# Altium project MeadowMinimum.PrjPcb
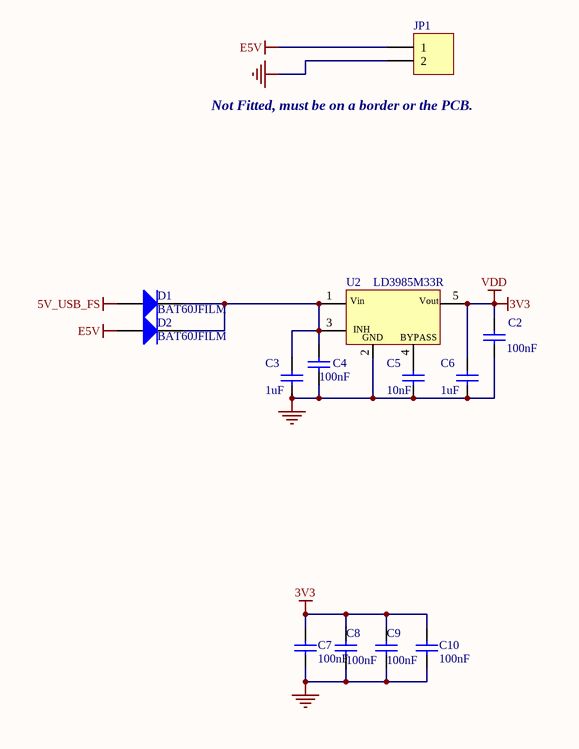
[diagram p0: Power.SchDoc]
5 sheets, 107 parts. Net scope: flat (ports and power ports of the same name join across sheets).
Board file: MeadowMinimum.PcbDoc
Sheets:
  Power.SchDoc
  STM32F7.SchDoc
  USB_OTG_FS.SchDoc
  FLASH QSPI.SchDoc
  SRAM.SchDoc

## Sheet Power.SchDoc
size A4

### Parts
C2  100nF  [0603]
C3  1uF  [0603]
C4  100nF  [0603]
C5  10nF  [0603]
C6  1uF  [0603]
C7  100nF  [0603]
C8  100nF  [0603]
C9  100nF  [0603]
C10  100nF  [0603]
D1  BAT60JFILM  [BAT60JFILM]
D2  BAT60JFILM  [BAT60JFILM]
JP1  Header 2  [HDR1X2]  (value not drawn)
U2  LD3985M33R  [LD3985M33R]

### Nets
3V3: C2.2 C6.1 C7.1 C8.2 C9.1 C10.1 U2.5(Vout)  [also labelled VDD]
5V_USB_FS: D1.1(A)  [project net 5V]
E5V: D2.1(A) JP1.1
GND: C2.1 C3.1 C4.1 C5.1 C6.2 C7.2 C8.1 C9.2 C10.2 JP1.2 U2.2(GND)
NetC3_2: C3.2 C4.2 D1.2(K) D2.2(K) U2.1(Vin) U2.3(CE)
NetC5_2: C5.2 U2.4(BYPASS)

### Notes on the sheet
- (near JP1) Not Fitted, must be on a border or the PCB.
- (in symbol LD3985M33R) INH

### Library data of the parts
C2 C4 C7-C10 = Cap_100nF_X7R_10%_0402: 0201; Manuf_Part_1: CC0402KRX7R7BB104; Manuf_1: YAGEO; Revision: July-2002: Re-released for DXP Platform.; Value: 100nF; Order: CC0402KRX7R7BB104
C3 C6 = Cap_1uF_X5R_10%_0603: 0201; Manuf_Part_1: CC0603KRX5R7BB105; Manuf_1: YAGEO; Revision: July-2002: Re-released for DXP Platform.; Value: 1uF; Order: CC0603KRX5R7BB105
C5 = Cap_10nF_X7R_10%_0603: 0201; Manuf_Part_1: CC0603KRX7R9BB103; Manuf_1: YAGEO; Revision: July-2002: Re-released for DXP Platform.; Value: 10nF; Order: CC0603KRX7R9BB103
D1 D2 = BAT60JFILM: Manuf_1: STM; Provided: ST; ECCN_US/EU: EAR99/NEC; Ref St: 9151097; Revision: July-2002: Re-released for DXP Platform.; Order: BAT60JFILM; Manuf_Part_1: BAT60JFILM; Distrib: ST
JP1 = Header 2: Header, 2-Pin; LatestRevisionDate: 17-Jul-2002; LatestRevisionNote: Re-released for DXP Platform.; Publisher: Altium Limited
U2 = LD3985M33R: Ultra low drop-low noise BiCMOS voltage, regulators low ESR capacitors compatible; Manuf_1: STM; Provided: ST; Ref St: 9176161; ECCN_US/EU: EAR99/NEC; Manuf_Part_1: LD3985M33R; Distrib: ST; Order: LD3985M33R

## Sheet STM32F7.SchDoc
size A3
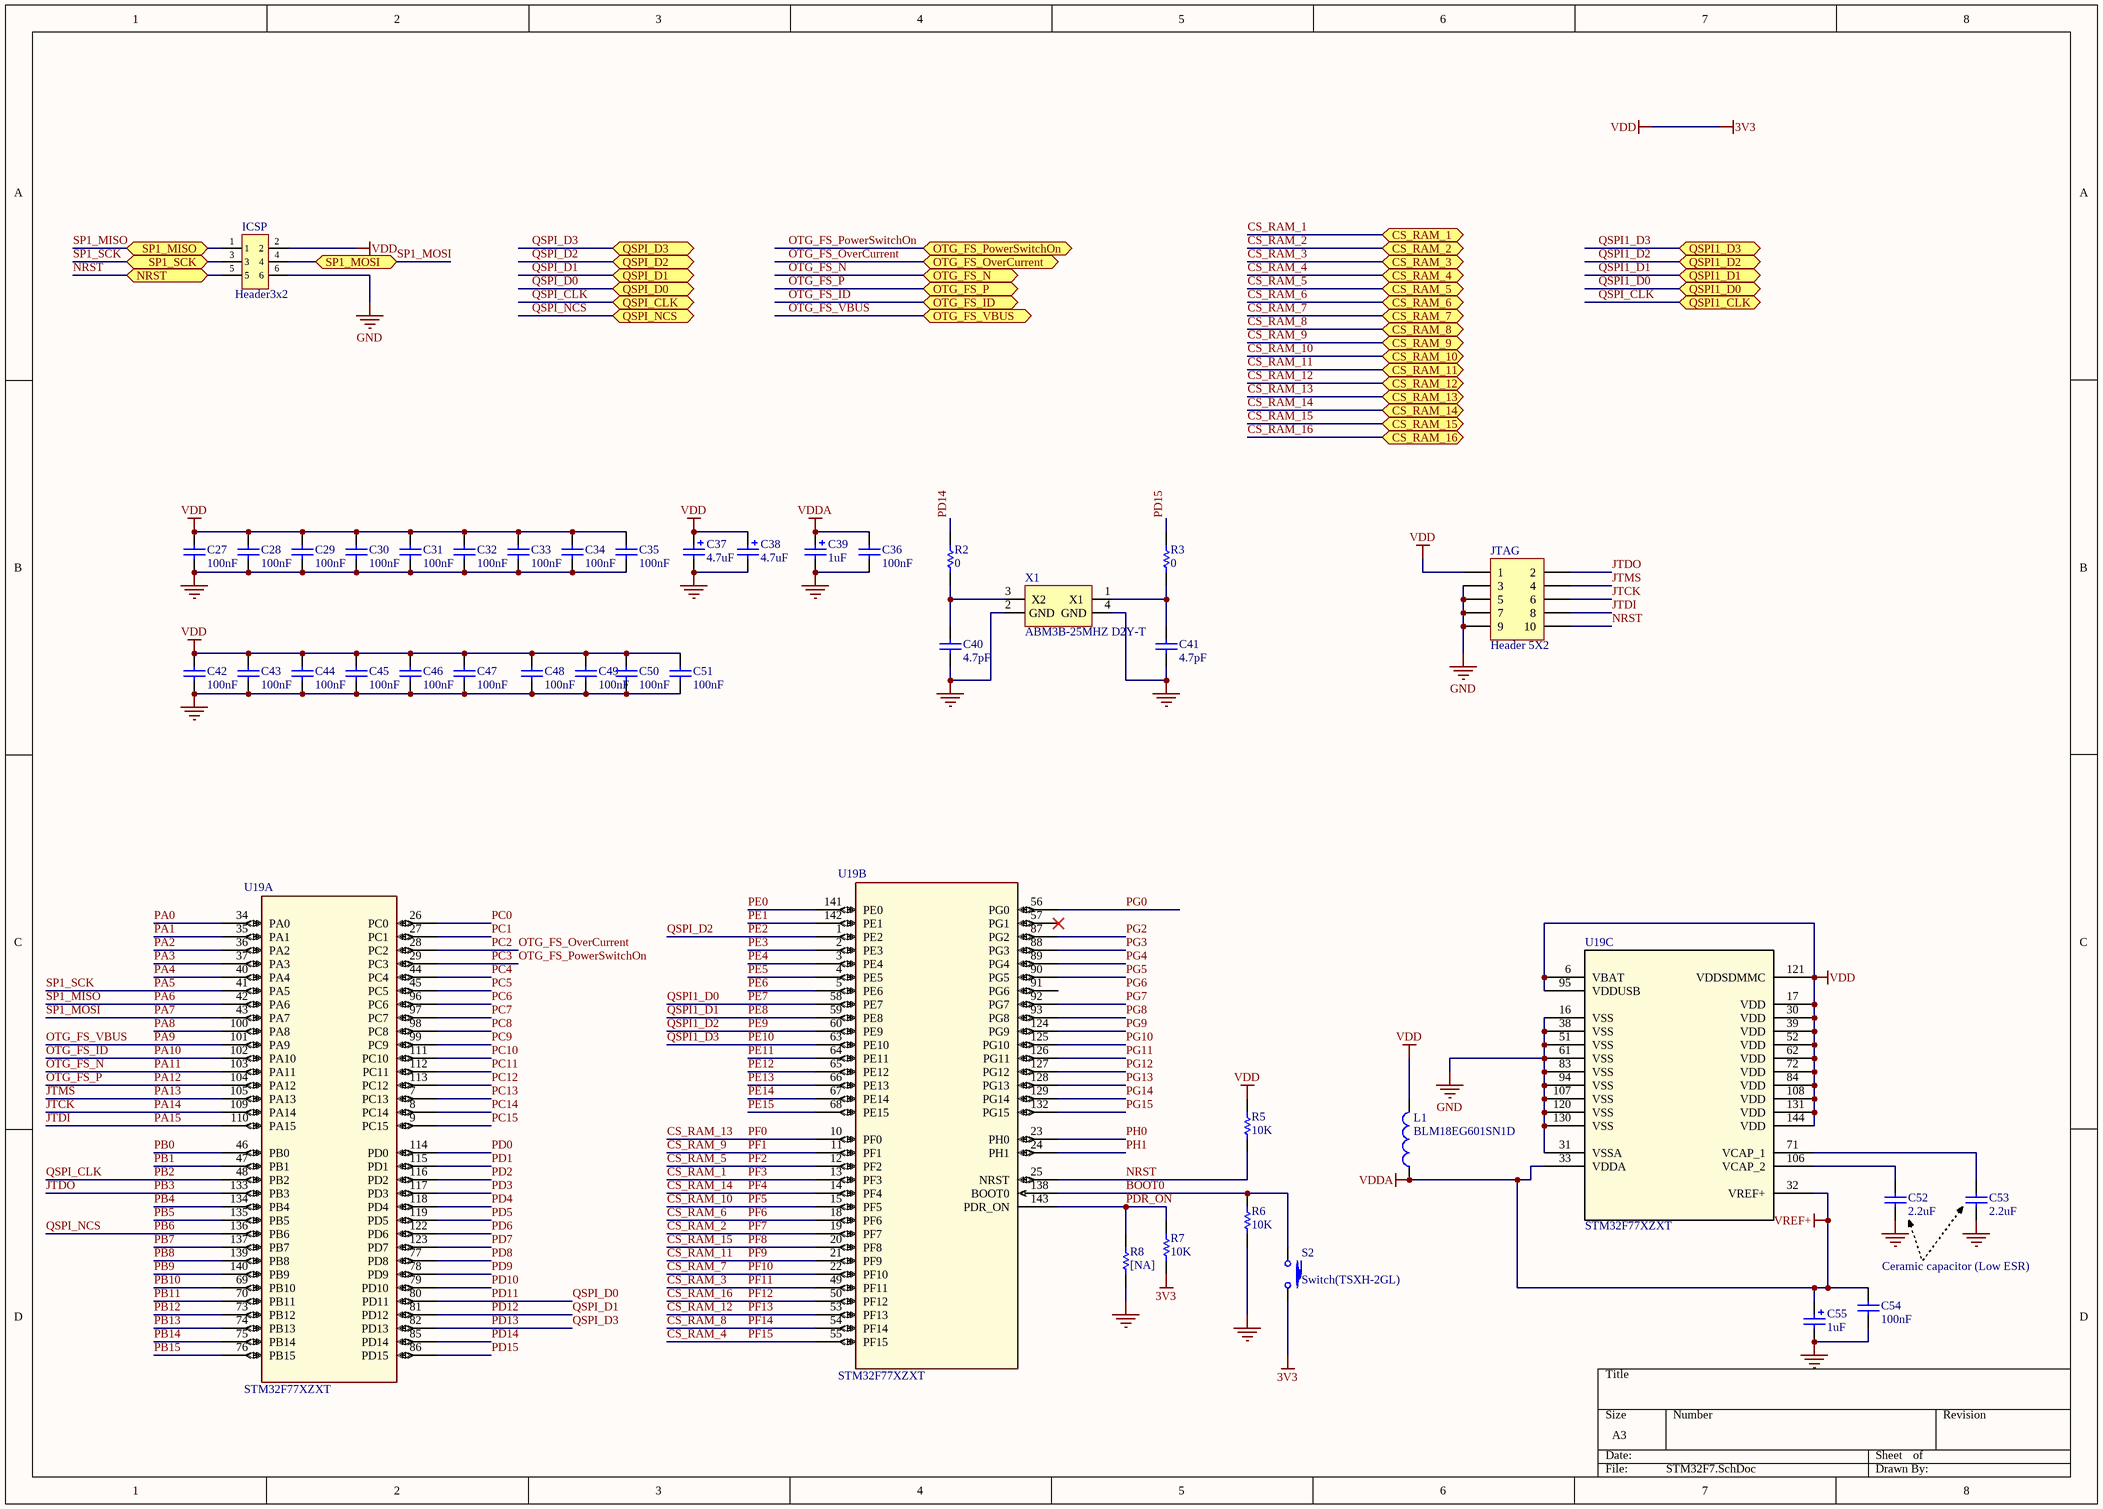
[diagram p1: STM32F7.SchDoc]

### Parts
C27  100nF  [0603]
C28  100nF  [0603]
C29  100nF  [0603]
C30  100nF  [0603]
C31  100nF  [0603]
C32  100nF  [0603]
C33  100nF  [0603]
C34  100nF  [0603]
C35  100nF  [0603]
C36  100nF  [0603]
C37  4.7uF  [0603]
C38  4.7uF  [0603]
C39  1uF  [0603]
C40  4.7pF  [0603]
C41  4.7pF  [0603]
C42  100nF  [0603]
C43  100nF  [0603]
C44  100nF  [0603]
C45  100nF  [0603]
C46  100nF  [0603]
C47  100nF  [0603]
C48  100nF  [0603]
C49  100nF  [0603]
C50  100nF  [0603]
C51  100nF  [0603]
C52  2.2uF  [0603]
C53  2.2uF  [0603]
C54  100nF  [0603]
C55  1uF  [0603]
ICSP  Header3x2  [6 pin Header]
JTAG  Header 5X2  [10 Pin Header]
L1  BLM18EG601SN1D  [0603]
R2  0  [0603]
R3  0  [0603]
R5  10K  [0603]
R6  10K  [0603]
R7  10K  [0603]
R8  [NA]  [0603]
S2  Switch(TSXH-2GL)  [Switch]
U19  STM32F77XZXT  [STM32F777ZI]  (parts A,B,C of 3)
X1  ABM3B-25MHZ D2Y-T  [25MHZ ABM3B-25MHZ D2Y-T]

### Ports
CS_RAM_1, CS_RAM_2, CS_RAM_3, CS_RAM_4, CS_RAM_5, CS_RAM_6, CS_RAM_7, CS_RAM_8, CS_RAM_9, CS_RAM_10, CS_RAM_11, CS_RAM_12, CS_RAM_13, CS_RAM_14, CS_RAM_15, CS_RAM_16, NRST, OTG_FS_ID, OTG_FS_N, OTG_FS_OverCurrent, OTG_FS_P, OTG_FS_PowerSwitchOn, OTG_FS_VBUS, QSPI1_CLK, QSPI1_D0, QSPI1_D1, QSPI1_D2, QSPI1_D3, QSPI_CLK, QSPI_D0, QSPI_D1, QSPI_D2, QSPI_D3, QSPI_NCS, SP1_MISO, SP1_MOSI, SP1_SCK

### Nets
3V3: C27.1 C28.1 C29.1 C30.1 C31.1 C32.1 C33.1 C34.1 C35.1 C37.1 C38.1 C42.1 C43.1 C44.1 C45.1 C46.1 C47.1 C48.1 C49.1 C50.1 C51.1 ICSP.2 JTAG.1 L1.2 R5.2 R7.1 S2.2 U19.6(VBAT) U19.17(VDD) U19.30(VDD) U19.39(VDD) U19.52(VDD) U19.62(VDD) U19.72(VDD) U19.84(VDD) U19.95(VDDUSB) U19.108(VDD) U19.121(VDDSDMMC) U19.131(VDD) U19.144(VDD)  [also labelled VDD]
GND: C27.2 C28.2 C29.2 C30.2 C31.2 C32.2 C33.2 C34.2 C35.2 C36.2 C37.2 C38.2 C39.2 C40.2 C41.2 C42.2 C43.2 C44.2 C45.2 C46.2 C47.2 C48.2 C49.2 C50.2 C51.2 C52.2 C53.2 C54.2 C55.2 ICSP.6 JTAG.3 JTAG.5 JTAG.7 JTAG.9 R6.2 R8.2 U19.16(VSS) U19.31(VSSA) U19.38(VSS) U19.51(VSS) U19.61(VSS) U19.83(VSS) U19.94(VSS) U19.107(VSS) U19.120(VSS) U19.130(VSS) X1.2(GND) X1.4(GND)
VDDA: C36.1 C39.1 C54.1 C55.1 L1.1 U19.32(VREF+) U19.33(VDDA)  [also labelled VREF+]
BOOT0: R6.1 S2.1 U19.138(BOOT0)
CS_RAM_1: U19.13(PF3) ; port CS_RAM_1  [also labelled PF3]
CS_RAM_2: U19.19(PF7) ; port CS_RAM_2  [also labelled PF7]
CS_RAM_3: U19.49(PF11) ; port CS_RAM_3  [also labelled PF11]
CS_RAM_4: U19.55(PF15) ; port CS_RAM_4  [also labelled PF15]
CS_RAM_5: U19.12(PF2) ; port CS_RAM_5  [also labelled PF2]
CS_RAM_6: U19.18(PF6) ; port CS_RAM_6  [also labelled PF6]
CS_RAM_7: U19.22(PF10) ; port CS_RAM_7  [also labelled PF10]
CS_RAM_8: U19.54(PF14) ; port CS_RAM_8  [also labelled PF14]
CS_RAM_9: U19.11(PF1) ; port CS_RAM_9  [also labelled PF1]
CS_RAM_10: U19.15(PF5) ; port CS_RAM_10  [also labelled PF5]
CS_RAM_11: U19.21(PF9) ; port CS_RAM_11  [also labelled PF9]
CS_RAM_12: U19.53(PF13) ; port CS_RAM_12  [also labelled PF13]
CS_RAM_13: U19.10(PF0) ; port CS_RAM_13  [also labelled PF0]
CS_RAM_14: U19.14(PF4) ; port CS_RAM_14  [also labelled PF4]
CS_RAM_15: U19.20(PF8) ; port CS_RAM_15  [also labelled PF8]
CS_RAM_16: U19.50(PF12) ; port CS_RAM_16  [also labelled PF12]
JTCK: JTAG.6 U19.109(PA14)  [also labelled PA14]
JTDI: JTAG.8 U19.110(PA15)  [also labelled PA15]
JTDO: JTAG.2 U19.133(PB3)  [also labelled PB3]
JTMS: JTAG.4 U19.105(PA13)  [also labelled PA13]
NRST: ICSP.5 JTAG.10 R5.1 U19.25(NRST) ; port NRST
OTG_FS_ID: U19.102(PA10) ; port OTG_FS_ID  [also labelled PA10]
OTG_FS_N: U19.103(PA11) ; port OTG_FS_N  [also labelled PA11]
OTG_FS_OverCurrent: U19.28(PC2) ; port OTG_FS_OverCurrent  [also labelled PC2]
OTG_FS_P: U19.104(PA12) ; port OTG_FS_P  [also labelled PA12]
OTG_FS_PowerSwitchOn: U19.29(PC3) ; port OTG_FS_PowerSwitchOn  [also labelled PC3]
OTG_FS_VBUS: U19.101(PA9) ; port OTG_FS_VBUS  [also labelled PA9]
PA0: U19.34(PA0)
PA1: U19.35(PA1)
PA2: U19.36(PA2)
PA3: U19.37(PA3)
PA4: U19.40(PA4)
PA5: ICSP.3 U19.41(PA5) ; port SP1_SCK  [also labelled SP1_SCK]
PA6: ICSP.1 U19.42(PA6) ; port SP1_MISO  [also labelled SP1_MISO]
PA7: ICSP.4 U19.43(PA7) ; port SP1_MOSI  [also labelled SP1_MOSI]
PA8: U19.100(PA8)
PB0: U19.46(PB0)
PB1: U19.47(PB1)
PB2: U19.48(PB2) ; port QSPI_CLK, port QSPI1_CLK  [also labelled QSPI_CLK]
PB4: U19.134(PB4)
PB5: U19.135(PB5)
PB6: U19.136(PB6) ; port QSPI_NCS  [also labelled QSPI_NCS]
PB7: U19.137(PB7)
PB8: U19.139(PB8)
PB9: U19.140(PB9)
PB10: U19.69(PB10)
PB11: U19.70(PB11)
PB12: U19.73(PB12)
PB13: U19.74(PB13)
PB14: U19.75(PB14)
PB15: U19.76(PB15)
PC0: U19.26(PC0)
PC1: U19.27(PC1)
PC4: U19.44(PC4)
PC5: U19.45(PC5)
PC6: U19.96(PC6)
PC7: U19.97(PC7)
PC8: U19.98(PC8)
PC9: U19.99(PC9)
PC10: U19.111(PC10)
PC11: U19.112(PC11)
PC12: U19.113(PC12)
PC13: U19.7(PC13)
PC14: U19.8(PC14)
PC15: U19.9(PC15)
PD0: U19.114(PD0)
PD1: U19.115(PD1)
PD2: U19.116(PD2)
PD3: U19.117(PD3)
PD4: U19.118(PD4)
PD5: U19.119(PD5)
PD6: U19.122(PD6)
PD7: U19.123(PD7)
PD8: U19.77(PD8)
PD9: U19.78(PD9)
PD10: U19.79(PD10)
PD11: U19.80(PD11) ; port QSPI_D0  [also labelled QSPI_D0]
PD12: U19.81(PD12) ; port QSPI_D1  [also labelled QSPI_D1]
PD13: U19.82(PD13) ; port QSPI_D3  [also labelled QSPI_D3]
PD14: R2.2 U19.85(PD14)
PD15: R3.2 U19.86(PD15)
PDR_ON: R7.2 R8.1 U19.143(PDR_ON)
PE0: U19.141(PE0)
PE1: U19.142(PE1)
PE2: U19.1(PE2) ; port QSPI_D2  [also labelled QSPI_D2]
PE3: U19.2(PE3)
PE4: U19.3(PE4)
PE5: U19.4(PE5)
PE6: U19.5(PE6)
PE7: U19.58(PE7) ; port QSPI1_D0  [also labelled QSPI1_D0]
PE8: U19.59(PE8) ; port QSPI1_D1  [also labelled QSPI1_D1]
PE9: U19.60(PE9) ; port QSPI1_D2  [also labelled QSPI1_D2]
PE10: U19.63(PE10) ; port QSPI1_D3  [also labelled QSPI1_D3]
PE11: U19.64(PE11)
PE12: U19.65(PE12)
PE13: U19.66(PE13)
PE14: U19.67(PE14)
PE15: U19.68(PE15)
PG0: U19.56(PG0)
PG2: U19.87(PG2)
PG3: U19.88(PG3)
PG4: U19.89(PG4)
PG5: U19.90(PG5)
PG7: U19.92(PG7)
PG8: U19.93(PG8)
PG9: U19.124(PG9)
PG10: U19.125(PG10)
PG11: U19.126(PG11)
PG12: U19.127(PG12)
PG13: U19.128(PG13)
PG14: U19.129(PG14)
PG15: U19.132(PG15)
PH0: U19.23(PH0)
PH1: U19.24(PH1)
NetC40_1: C40.1 R2.1 X1.3(X2)
NetC41_1: C41.1 R3.1 X1.1(X1)
NetC52_1: C52.1 U19.106(VCAP_2)
NetC53_1: C53.1 U19.71(VCAP_1)

Not connected (* = marked no-connect by the designer): U19 57(PG1)* 91(PG6)

### Notes on the sheet
- (near C54) Ceramic capacitor (Low ESR)
- Labels drawn without touching a wire or pin: PG6

### Library data of the parts
C27-C36 C42-C51 C54 = Cap_100nF_X7R_10%_0402: as C2 on sheet Power; Revision: July-2002: Re-released for DXP Platform.; Value: 100nF; Order: CC0402KRX7R7BB104
C37 C38 = Cap_4.7uF_POL_10%_TANA: 0201; Manuf_1: AVX; Manuf_Part_1: TAJA475K016R; Revision: July-2002: Re-released for DXP Platform.; Value: 4.7uF; Order: TAJA475K016R; ECCN_US/EU: n/a
C39 C55 = Cap_1uF_POL_10%_TANA: 0201; Manuf_1: AVX; Manuf_Part_1: TAJA105K016R; Revision: July-2002: Re-released for DXP Platform.; Value: 1uF; Distrib: *; Order: TAJA105K016R; ECCN_US/EU: n/a
C40 C41 = Cap_4.7pF_NPO_-+0.25pF_0402: 0201; Manuf_1: YAGEO; Manuf_Part_1: CC0402CRNPO9BN4R7; Order: 311-1367-2-ND; Revision: July-2002: Re-released for DXP Platform.; Value: 4.7pF; ECCN_US/EU: n/a; Distrib: DIGIKEY
C52 C53 = Cap_2.2uF_X7R_10%_1206: 0201; Manuf_Part_1: CC1206KKX7R7BB225; Manuf_1: YAGEO; Manuf_Part_2: C1206C225K4RAC; Manuf_2: KEMET; Revision: July-2002: Re-released for DXP Platform.; Value: 2.2uF; Order: CC1206KKX7R7BB225; ECCN_US/EU: n/a
ICSP = 6 pin Header
JTAG = Header 5X2: Header, 5-Pin, Dual row; LatestRevisionDate: 17-Jul-2002; LatestRevisionNote: Re-released for DXP Platform.; Publisher: Altium Limited
L1 = BEAD_600R_350MA_0603: Bead,600R,350mA,0603,FCM1608KF-601T03,Tai-tech; Manuf_2: TDK; Manuf_Part_2: MPZ1608S300A; Manuf_Part_3: BLM18PG121SN1D; Manuf_3: MURATA; Value: 100uH; Description_2: Bead,30R,5A,0603,MPZ1608S300A,TDK; Description_3: Bead,120R,2A,0603,BLM18PG121SN1D,MURATA; Revision: July-2002: Re-released for DXP Platform.; Manuf_Part_1: FCM1608KF-601T03; Manuf_1: Tai-tech; ECCN_US/EU: n/a
R2 R3 = Res_0_5%_0402: 0201; Manuf_Part_1: RC0402JR-070RL; Manuf_1: YAGEO; Order: 2363467; Value: 0; ECCN_US/EU: n/a; Distrib: FARNELL
R5-R7 = Res_10K_1%_0402: 0201; Manuf_Part_1: RC0402FR-0710KL; Manuf_1: YAGEO; Value: 10K; Order: RC0402FR-0710KL; ECCN_US/EU: n/a
R8 = Res_NA_0402: 0201; Fitted: NO; Value: [NA]; ECCN_US/EU: n/a
U19 = STM32F77XZXT: Imported; Vendor: STMicroelectronics; C: Copyright (C) 2016 Accelerated Designs. All rights reserved; Manufacturer_Part_Number: stm32f77xzxt; Copyright: Copyright (C) 2016 Accelerated Designs. All rights reserved; RefDes: RefDes; Type: Type; Value: Value
X1 = ABM3B-25MHZ D2Y-T: 25MHz Crystal

## Sheet USB_OTG_FS.SchDoc
size A3
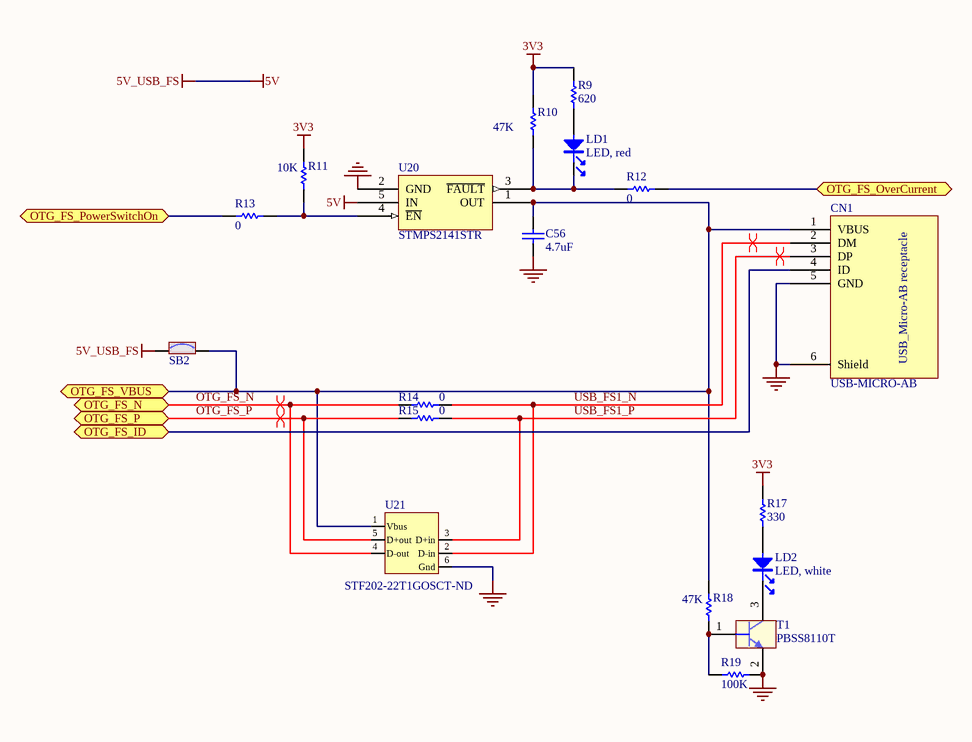
[diagram p2: USB_OTG_FS.SchDoc]

### Parts
C56  4.7uF  [0603]
CN1  USB-MICRO-AB  [USB-MICRO-AB, 47590-0001, SMT, MOLEX]
LD1  LED, red  [0603]
LD2  LED, white  [0603]
R9  620  [0603]
R10  47K  [0603]
R11  10K  [0603]
R12  0  [0603]
R13  0  [0603]
R14  0  [0603]
R15  0  [0603]
R17  330  [0603]
R18  47K  [0603]
R19  100K  [0603]
SB2  Solder Bridge ON  [0603]  (value not drawn)
T1  PBSS8110T  [CMBT 9013]
U20  STMPS2141STR  [STMPS2141STR]
U21  STF202-22T1GOSCT-ND  [SOT-457]

### Ports
OTG_FS_ID, OTG_FS_N, OTG_FS_OverCurrent, OTG_FS_P, OTG_FS_PowerSwitchOn, OTG_FS_VBUS

### Nets
3V3: R9.2 R10.2 R11.2 R17.2
5V: SB2.1 U20.5(IN)  [also labelled 5V_USB_FS]
GND: C56.2 CN1.5(GND) CN1.6(Shield) R19.2 T1.2(E) U20.2(GND) U21.6(Gnd)
OTG_FS_ID: CN1.4(ID) ; port OTG_FS_ID
OTG_FS_N: R14.1 U21.4(D-out) ; port OTG_FS_N
OTG_FS_OverCurrent: R12.2 ; port OTG_FS_OverCurrent
OTG_FS_P: R15.1 U21.5(D+out) ; port OTG_FS_P
OTG_FS_PowerSwitchOn: R13.1 ; port OTG_FS_PowerSwitchOn
OTG_FS_VBUS: C56.1 CN1.1(VBUS) R18.2 SB2.2 U20.1(OUT) U21.1(Vbus) ; port OTG_FS_VBUS
USB_FS1_N: CN1.2(DM) R14.2 U21.2(D-in)
USB_FS1_P: CN1.3(DP) R15.2 U21.3(D+in)
NetLD1_1: LD1.1 R9.1
NetLD1_2: LD1.2 R10.1 R12.1 U20.3(~{FAULT})
NetLD2_1: LD2.1 R17.1
NetLD2_2: LD2.2 T1.3(C)
NetR11_1: R11.1 R13.2 U20.4(~{EN})
NetR18_1: R18.1 R19.1 T1.1(B)

### Layout directives
differential pair: OTG_FS_N, OTG_FS_P, USB_FS1_N, USB_FS1_P

### Notes on the sheet
- (in symbol USB-MICRO-AB) USB_Micro-AB receptacle

### Library data of the parts
C56 = Cap_4.7uF_X5R_10%_0603: 0201; Manuf_Part_1: CC0603KRX5R7BB475; Manuf_1: YAGEO; Value: 10uF; Order: CC0603KRX5R7BB105; Revision: July-2002: Re-released for DXP Platform.; ECCN_US/EU: n/a
CN1 = USB-MICRO-AB: USB-MICRO-AB, 47590-0001, SMT, MOLEX; Ref St: xxxxxxx; Manuf_1: MOLEX; Manuf_Part_1: 47590-0001; ECCN_US/EU: n/a; Distrib: *
LD1 = LED_red: LED, red, 0603; Manuf_1: everlight; Manuf_Part_1: 19-213-R6C-AP1Q2B/3T; ECCN_US/EU: EAR99/NEC; Order: 19-213-R6C-AP1Q2B/3T
LD2 = LED_green: LED, green, 0603; Manuf_1: everlight; Manuf_Part_1: 19-213SYGC/S530-E2/TR8; ECCN_US/EU: EAR99/NEC; Order: 19-213SYGC/S530-E2/TR8
R9 = Res_620_1%_0603: 0201; Manuf_Part_1: CRCW0603620RFKEA; Manuf_1: VISHAY DRALORIC; Order: 2122341; Value: 620; ECCN_US/EU: n/a; Distrib: FARNELL
R10 R18 = Res_47K_1%_0402: 0201; Manuf_Part_1: RC0402FR-0747KL; Manuf_1: YAGEO; Order: 9239430; Value: 47K; ECCN_US/EU: n/a; Distrib: FARNELL
R11 = Res_10K_1%_0402: as R5 on sheet STM32F7; Value: 10K; Order: RC0402FR-0710KL; ECCN_US/EU: n/a
R12-R15 = Res_0_5%_0402: as R2 on sheet STM32F7; Value: 0; ECCN_US/EU: n/a; Distrib: FARNELL
R17 = Res_330_1%_0603: 0201; Manuf_Part_1: RT0603FRE07330RL; Manuf_1: YAGEO; Order: 1500622RL; Value: 330; ECCN_US/EU: n/a; Distrib: FARNELL
R19 = Res_100K_1%_0402: 0201; Manuf_Part_1: RT0402FRE07100KL; Manuf_1: YAGEO; Value: 100K; Order: RT0402FRE07100KL; ECCN_US/EU: n/a
SB2 = SB_ON: Solder: YES; Revision: July-2002: Re-released for DXP Platform.; ECCN_US/EU: n/a
T1 = 9013-SOT23: NPN Bipolar Transistor; Manuf_1: NXP; Manuf_Part_1: BSR14; Order: 1081310; ECCN_US/EU: EAR99/NEC; Revision: July-2002: Re-released for DXP Platform.; Distrib: FARNELL
U20 = STMPS2141STR: Enhanced single channel power switches; Manuf_1: STM; Provided: ST; ECCN_US/EU: EAR99/NEC; Ref St: 9159003; Order: STMPS2141STR; Manuf_Part_1: STMPS2141STR; Distrib: ST

## Sheet FLASH QSPI.SchDoc
size A
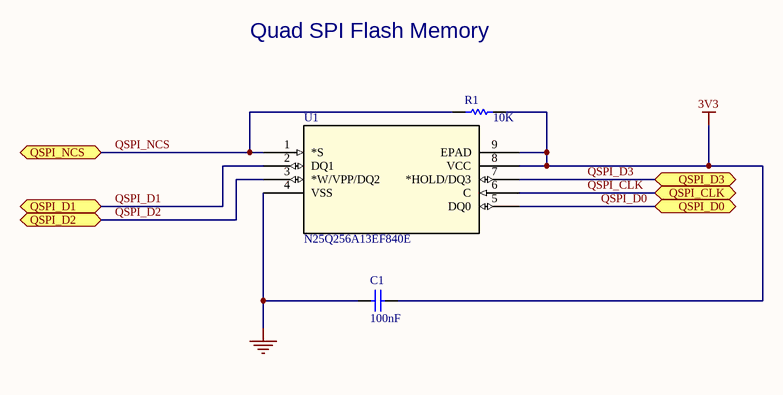
[diagram p3: FLASH QSPI.SchDoc]

### Parts
C1  100nF  [0603]
R1  10K  [0603]
U1  N25Q256A13EF840E  [N25Q256A13EF840E]

### Ports
QSPI_CLK, QSPI_D0, QSPI_D1, QSPI_D2, QSPI_D3, QSPI_NCS

### Nets
3V3: C1.1 R1.2 U1.8(VCC) U1.9(EPAD)
GND: C1.2 U1.4(VSS)
QSPI_CLK: U1.6(C) ; port QSPI_CLK  [project net PB2]
QSPI_D0: U1.5(DQ0) ; port QSPI_D0  [project net PD11]
QSPI_D1: U1.2(DQ1) ; port QSPI_D1  [project net PD12]
QSPI_D2: U1.3(*W/VPP/DQ2) ; port QSPI_D2  [project net PE2]
QSPI_D3: U1.7(*HOLD/DQ3) ; port QSPI_D3  [project net PD13]
QSPI_NCS: R1.1 U1.1(*S) ; port QSPI_NCS  [project net PB6]

### Notes on the sheet
- Quad SPI Flash Memory

### Library data of the parts
C1 = Cap_100nF_X7R_10%_0402: as C2 on sheet Power; Revision: July-2002: Re-released for DXP Platform.; Value: 100nF; Order: CC0402KRX7R7BB104; ECCN_US/EU: n/a
R1 = Res_10K_1%_0402: as R5 on sheet STM32F7; Value: 10K; Order: RC0402FR-0710KL; ECCN_US/EU: n/a

## Sheet SRAM.SchDoc
size A3
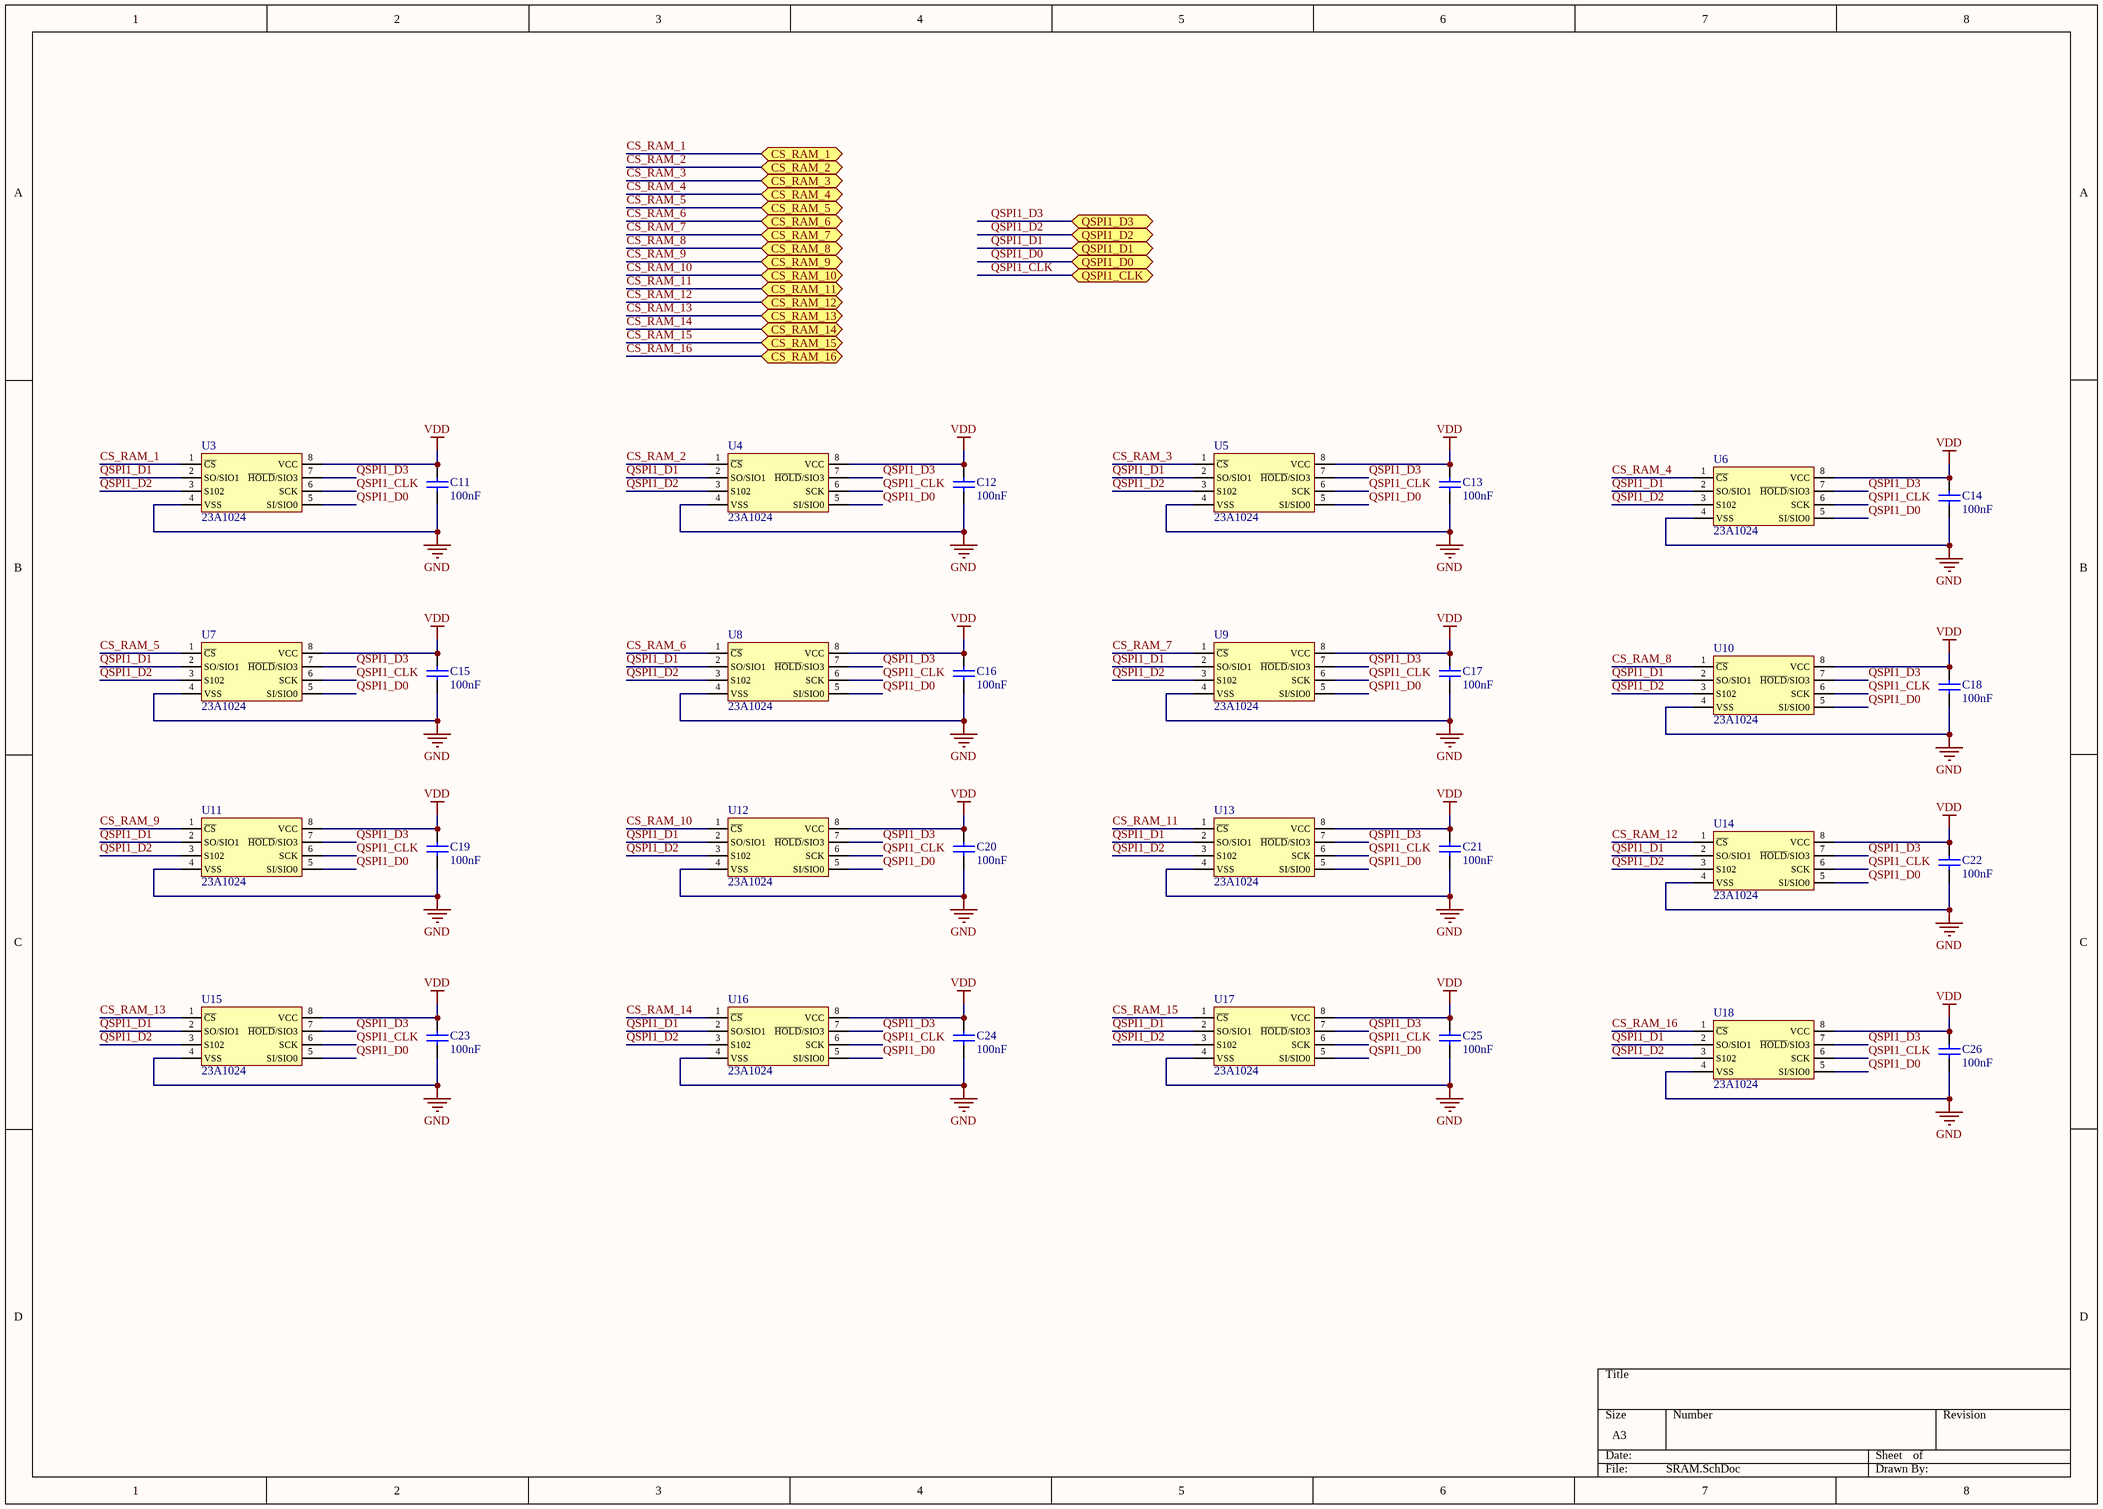
[diagram p4: SRAM.SchDoc]

### Parts
C11  100nF  [0603]
C12  100nF  [0603]
C13  100nF  [0603]
C14  100nF  [0603]
C15  100nF  [0603]
C16  100nF  [0603]
C17  100nF  [0603]
C18  100nF  [0603]
C19  100nF  [0603]
C20  100nF  [0603]
C21  100nF  [0603]
C22  100nF  [0603]
C23  100nF  [0603]
C24  100nF  [0603]
C25  100nF  [0603]
C26  100nF  [0603]
U3  23A1024  [23A1024]
U4  23A1024  [23A1024]
U5  23A1024  [23A1024]
U6  23A1024  [23A1024]
U7  23A1024  [23A1024]
U8  23A1024  [23A1024]
U9  23A1024  [23A1024]
U10  23A1024  [23A1024]
U11  23A1024  [23A1024]
U12  23A1024  [23A1024]
U13  23A1024  [23A1024]
U14  23A1024  [23A1024]
U15  23A1024  [23A1024]
U16  23A1024  [23A1024]
U17  23A1024  [23A1024]
U18  23A1024  [23A1024]

### Ports
CS_RAM_1, CS_RAM_2, CS_RAM_3, CS_RAM_4, CS_RAM_5, CS_RAM_6, CS_RAM_7, CS_RAM_8, CS_RAM_9, CS_RAM_10, CS_RAM_11, CS_RAM_12, CS_RAM_13, CS_RAM_14, CS_RAM_15, CS_RAM_16, QSPI1_CLK, QSPI1_D0, QSPI1_D1, QSPI1_D2, QSPI1_D3

### Nets
GND: C11.2 C12.2 C13.2 C14.2 C15.2 C16.2 C17.2 C18.2 C19.2 C20.2 C21.2 C22.2 C23.2 C24.2 C25.2 C26.2 U3.4(VSS) U4.4(VSS) U5.4(VSS) U6.4(VSS) U7.4(VSS) U8.4(VSS) U9.4(VSS) U10.4(VSS) U11.4(VSS) U12.4(VSS) U13.4(VSS) U14.4(VSS) U15.4(VSS) U16.4(VSS) U17.4(VSS) U18.4(VSS)
VDD: C11.1 C12.1 C13.1 C14.1 C15.1 C16.1 C17.1 C18.1 C19.1 C20.1 C21.1 C22.1 C23.1 C24.1 C25.1 C26.1 U3.8(VCC) U4.8(VCC) U5.8(VCC) U6.8(VCC) U7.8(VCC) U8.8(VCC) U9.8(VCC) U10.8(VCC) U11.8(VCC) U12.8(VCC) U13.8(VCC) U14.8(VCC) U15.8(VCC) U16.8(VCC) U17.8(VCC) U18.8(VCC)  [project net 3V3]
CS_RAM_1: U3.1(~{CS}) ; port CS_RAM_1
CS_RAM_2: U4.1(~{CS}) ; port CS_RAM_2
CS_RAM_3: U5.1(~{CS}) ; port CS_RAM_3
CS_RAM_4: U6.1(~{CS}) ; port CS_RAM_4
CS_RAM_5: U7.1(~{CS}) ; port CS_RAM_5
CS_RAM_6: U8.1(~{CS}) ; port CS_RAM_6
CS_RAM_7: U9.1(~{CS}) ; port CS_RAM_7
CS_RAM_8: U10.1(~{CS}) ; port CS_RAM_8
CS_RAM_9: U11.1(~{CS}) ; port CS_RAM_9
CS_RAM_10: U12.1(~{CS}) ; port CS_RAM_10
CS_RAM_11: U13.1(~{CS}) ; port CS_RAM_11
CS_RAM_12: U14.1(~{CS}) ; port CS_RAM_12
CS_RAM_13: U15.1(~{CS}) ; port CS_RAM_13
CS_RAM_14: U16.1(~{CS}) ; port CS_RAM_14
CS_RAM_15: U17.1(~{CS}) ; port CS_RAM_15
CS_RAM_16: U18.1(~{CS}) ; port CS_RAM_16
QSPI1_CLK: U3.6(SCK) U4.6(SCK) U5.6(SCK) U6.6(SCK) U7.6(SCK) U8.6(SCK) U9.6(SCK) U10.6(SCK) U11.6(SCK) U12.6(SCK) U13.6(SCK) U14.6(SCK) U15.6(SCK) U16.6(SCK) U17.6(SCK) U18.6(SCK) ; port QSPI1_CLK  [project net PB2]
QSPI1_D0: U3.5(SI/SIO0) U4.5(SI/SIO0) U5.5(SI/SIO0) U6.5(SI/SIO0) U7.5(SI/SIO0) U8.5(SI/SIO0) U9.5(SI/SIO0) U10.5(SI/SIO0) U11.5(SI/SIO0) U12.5(SI/SIO0) U13.5(SI/SIO0) U14.5(SI/SIO0) U15.5(SI/SIO0) U16.5(SI/SIO0) U17.5(SI/SIO0) U18.5(SI/SIO0) ; port QSPI1_D0  [project net PE7]
QSPI1_D1: U3.2(SO/SIO1) U4.2(SO/SIO1) U5.2(SO/SIO1) U6.2(SO/SIO1) U7.2(SO/SIO1) U8.2(SO/SIO1) U9.2(SO/SIO1) U10.2(SO/SIO1) U11.2(SO/SIO1) U12.2(SO/SIO1) U13.2(SO/SIO1) U14.2(SO/SIO1) U15.2(SO/SIO1) U16.2(SO/SIO1) U17.2(SO/SIO1) U18.2(SO/SIO1) ; port QSPI1_D1  [project net PE8]
QSPI1_D2: U3.3(S102) U4.3(S102) U5.3(S102) U6.3(S102) U7.3(S102) U8.3(S102) U9.3(S102) U10.3(S102) U11.3(S102) U12.3(S102) U13.3(S102) U14.3(S102) U15.3(S102) U16.3(S102) U17.3(S102) U18.3(S102) ; port QSPI1_D2  [project net PE9]
QSPI1_D3: U3.7(~{HOLD}/SIO3) U4.7(~{HOLD}/SIO3) U5.7(~{HOLD}/SIO3) U6.7(~{HOLD}/SIO3) U7.7(~{HOLD}/SIO3) U8.7(~{HOLD}/SIO3) U9.7(~{HOLD}/SIO3) U10.7(~{HOLD}/SIO3) U11.7(~{HOLD}/SIO3) U12.7(~{HOLD}/SIO3) U13.7(~{HOLD}/SIO3) U14.7(~{HOLD}/SIO3) U15.7(~{HOLD}/SIO3) U16.7(~{HOLD}/SIO3) U17.7(~{HOLD}/SIO3) U18.7(~{HOLD}/SIO3) ; port QSPI1_D3  [project net PE10]

### Library data of the parts
C11-C26 = Cap_100nF_X7R_10%_0402: as C2 on sheet Power; Revision: July-2002: Re-released for DXP Platform.; Value: 100nF; Order: CC0402KRX7R7BB104; ECCN_US/EU: n/a
U3-U18 = 23A1024: 1MB 1.8V 1MB QSPI SRAM    MOUSER PART # 579-23A1024-I/SN

## Nets that join several sheets
3V3: Power (7 pins), STM32F7 (40 pins), USB_OTG_FS (R9.2 R10.2 R11.2 R17.2), FLASH QSPI (C1.1 R1.2 U1.8 U1.9), SRAM (32 pins)
5V: Power (D1.1), USB_OTG_FS (SB2.1 U20.5)
GND: Power (11 pins), STM32F7 (48 pins), USB_OTG_FS (7 pins), FLASH QSPI (C1.2 U1.4), SRAM (32 pins)
CS_RAM_1: STM32F7 (U19.13), SRAM (U3.1)
CS_RAM_2: STM32F7 (U19.19), SRAM (U4.1)
CS_RAM_3: STM32F7 (U19.49), SRAM (U5.1)
CS_RAM_4: STM32F7 (U19.55), SRAM (U6.1)
CS_RAM_5: STM32F7 (U19.12), SRAM (U7.1)
CS_RAM_6: STM32F7 (U19.18), SRAM (U8.1)
CS_RAM_7: STM32F7 (U19.22), SRAM (U9.1)
CS_RAM_8: STM32F7 (U19.54), SRAM (U10.1)
CS_RAM_9: STM32F7 (U19.11), SRAM (U11.1)
CS_RAM_10: STM32F7 (U19.15), SRAM (U12.1)
CS_RAM_11: STM32F7 (U19.21), SRAM (U13.1)
CS_RAM_12: STM32F7 (U19.53), SRAM (U14.1)
CS_RAM_13: STM32F7 (U19.10), SRAM (U15.1)
CS_RAM_14: STM32F7 (U19.14), SRAM (U16.1)
CS_RAM_15: STM32F7 (U19.20), SRAM (U17.1)
CS_RAM_16: STM32F7 (U19.50), SRAM (U18.1)
OTG_FS_ID: STM32F7 (U19.102), USB_OTG_FS (CN1.4)
OTG_FS_N: STM32F7 (U19.103), USB_OTG_FS (R14.1 U21.4)
OTG_FS_OverCurrent: STM32F7 (U19.28), USB_OTG_FS (R12.2)
OTG_FS_P: STM32F7 (U19.104), USB_OTG_FS (R15.1 U21.5)
OTG_FS_PowerSwitchOn: STM32F7 (U19.29), USB_OTG_FS (R13.1)
OTG_FS_VBUS: STM32F7 (U19.101), USB_OTG_FS (6 pins)
PB2: STM32F7 (U19.48), FLASH QSPI (U1.6), SRAM (16 pins)
PB6: STM32F7 (U19.136), FLASH QSPI (R1.1 U1.1)
PD11: STM32F7 (U19.80), FLASH QSPI (U1.5)
PD12: STM32F7 (U19.81), FLASH QSPI (U1.2)
PD13: STM32F7 (U19.82), FLASH QSPI (U1.7)
PE2: STM32F7 (U19.1), FLASH QSPI (U1.3)
PE7: STM32F7 (U19.58), SRAM (16 pins)
PE8: STM32F7 (U19.59), SRAM (16 pins)
PE9: STM32F7 (U19.60), SRAM (16 pins)
PE10: STM32F7 (U19.63), SRAM (16 pins)